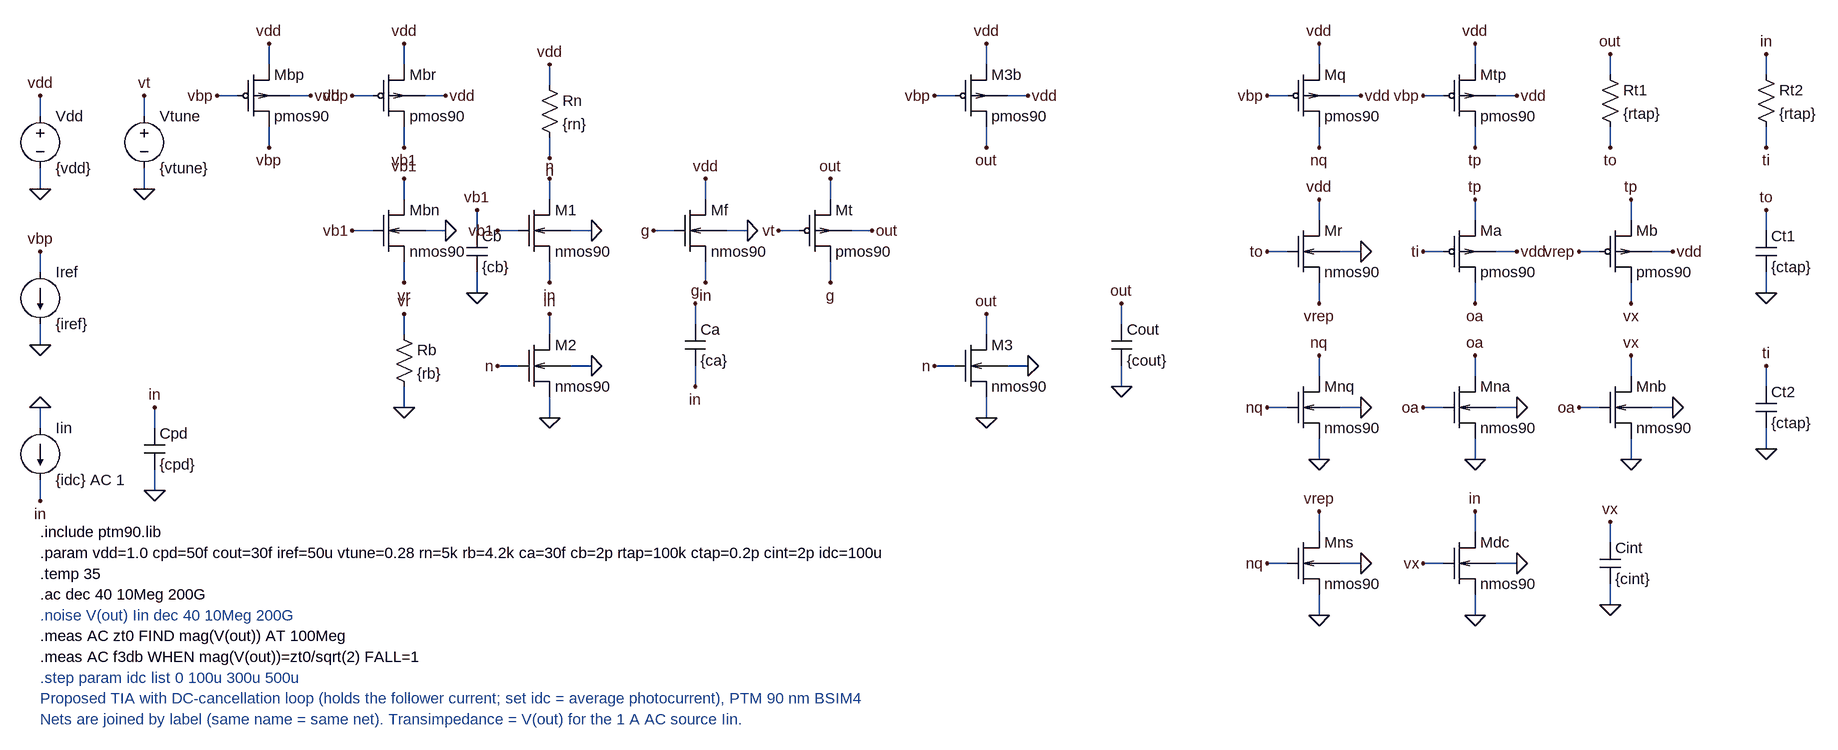
[diagram p0: schematic proposed_tia_dcc.asc]
proposed_tia_dcc.asc, the LTspice schematic file:
Version 4
SHEET 1 2200 1200
WIRE -720 80 -720 48
WIRE -720 160 -720 192
WIRE -560 80 -560 48
WIRE -560 160 -560 192
WIRE -720 320 -720 288
WIRE -720 400 -720 432
WIRE -368 96 -368 128
WIRE -416 48 -448 48
WIRE -368 0 -368 -32
WIRE -336 48 -304 48
WIRE -160 96 -160 128
WIRE -208 48 -240 48
WIRE -160 0 -160 -32
WIRE -128 48 -96 48
WIRE -160 208 -160 176
WIRE -208 256 -240 256
WIRE -160 304 -160 336
WIRE -128 256 -96 256
WIRE -160 416 -160 384
WIRE -160 496 -160 528
WIRE -48 256 -48 224
WIRE -48 320 -48 352
WIRE 64 32 64 0
WIRE 64 112 64 144
WIRE 64 208 64 176
WIRE 16 256 -16 256
WIRE 64 304 64 336
WIRE 96 256 128 256
WIRE 64 416 64 384
WIRE 16 464 -16 464
WIRE 64 512 64 544
WIRE 96 464 128 464
WIRE 736 416 736 384
WIRE 688 464 656 464
WIRE 736 512 736 544
WIRE 768 464 800 464
WIRE 736 96 736 128
WIRE 688 48 656 48
WIRE 736 0 736 -32
WIRE 768 48 800 48
WIRE 304 208 304 176
WIRE 256 256 224 256
WIRE 304 304 304 336
WIRE 336 256 368 256
WIRE 496 304 496 336
WIRE 448 256 416 256
WIRE 496 208 496 176
WIRE 528 256 560 256
WIRE 288 400 288 368
WIRE 288 464 288 496
WIRE 1248 96 1248 128
WIRE 1200 48 1168 48
WIRE 1248 0 1248 -32
WIRE 1280 48 1312 48
WIRE 1248 480 1248 448
WIRE 1200 528 1168 528
WIRE 1248 576 1248 608
WIRE 1280 528 1312 528
WIRE 1696 16 1696 -16
WIRE 1696 96 1696 128
WIRE 1936 256 1936 224
WIRE 1936 320 1936 352
WIRE 1936 16 1936 -16
WIRE 1936 96 1936 128
WIRE 1936 496 1936 464
WIRE 1936 560 1936 592
WIRE 1248 240 1248 208
WIRE 1200 288 1168 288
WIRE 1248 336 1248 368
WIRE 1280 288 1312 288
WIRE 1248 720 1248 688
WIRE 1200 768 1168 768
WIRE 1248 816 1248 848
WIRE 1280 768 1312 768
WIRE 1488 96 1488 128
WIRE 1440 48 1408 48
WIRE 1488 0 1488 -32
WIRE 1520 48 1552 48
WIRE 1488 336 1488 368
WIRE 1440 288 1408 288
WIRE 1488 240 1488 208
WIRE 1520 288 1552 288
WIRE 1728 336 1728 368
WIRE 1680 288 1648 288
WIRE 1728 240 1728 208
WIRE 1760 288 1792 288
WIRE 1488 480 1488 448
WIRE 1440 528 1408 528
WIRE 1488 576 1488 608
WIRE 1520 528 1552 528
WIRE 1728 480 1728 448
WIRE 1680 528 1648 528
WIRE 1728 576 1728 608
WIRE 1760 528 1792 528
WIRE 1696 736 1696 704
WIRE 1696 800 1696 832
WIRE 1488 720 1488 688
WIRE 1440 768 1408 768
WIRE 1488 816 1488 848
WIRE 1520 768 1552 768
WIRE -544 560 -544 528
WIRE -544 624 -544 656
WIRE 944 400 944 368
WIRE 944 464 944 496
WIRE -720 560 -720 528
WIRE -720 640 -720 672
FLAG -720 48 vdd
FLAG -720 192 0
FLAG -560 48 vt
FLAG -560 192 0
FLAG -720 288 vbp
FLAG -720 432 0
FLAG -368 128 vbp
FLAG -448 48 vbp
FLAG -368 -32 vdd
FLAG -304 48 vdd
FLAG -160 128 vb1
FLAG -240 48 vbp
FLAG -160 -32 vdd
FLAG -96 48 vdd
FLAG -160 176 vb1
FLAG -240 256 vb1
FLAG -160 336 vr
FLAG -96 256 0
FLAG -160 384 vr
FLAG -160 528 0
FLAG -48 224 vb1
FLAG -48 352 0
FLAG 64 0 vdd
FLAG 64 144 n
FLAG 64 176 n
FLAG -16 256 vb1
FLAG 64 336 in
FLAG 128 256 0
FLAG 64 384 in
FLAG -16 464 n
FLAG 64 544 0
FLAG 128 464 0
FLAG 736 384 out
FLAG 656 464 n
FLAG 736 544 0
FLAG 800 464 0
FLAG 736 128 out
FLAG 656 48 vbp
FLAG 736 -32 vdd
FLAG 800 48 vdd
FLAG 304 176 vdd
FLAG 224 256 g
FLAG 304 336 in
FLAG 368 256 0
FLAG 496 336 g
FLAG 416 256 vt
FLAG 496 176 out
FLAG 560 256 out
FLAG 288 368 g
FLAG 288 496 in
FLAG 1248 128 nq
FLAG 1168 48 vbp
FLAG 1248 -32 vdd
FLAG 1312 48 vdd
FLAG 1248 448 nq
FLAG 1168 528 nq
FLAG 1248 608 0
FLAG 1312 528 0
FLAG 1696 -16 out
FLAG 1696 128 to
FLAG 1936 224 to
FLAG 1936 352 0
FLAG 1936 -16 in
FLAG 1936 128 ti
FLAG 1936 464 ti
FLAG 1936 592 0
FLAG 1248 208 vdd
FLAG 1168 288 to
FLAG 1248 368 vrep
FLAG 1312 288 0
FLAG 1248 688 vrep
FLAG 1168 768 nq
FLAG 1248 848 0
FLAG 1312 768 0
FLAG 1488 128 tp
FLAG 1408 48 vbp
FLAG 1488 -32 vdd
FLAG 1552 48 vdd
FLAG 1488 368 oa
FLAG 1408 288 ti
FLAG 1488 208 tp
FLAG 1552 288 vdd
FLAG 1728 368 vx
FLAG 1648 288 vrep
FLAG 1728 208 tp
FLAG 1792 288 vdd
FLAG 1488 448 oa
FLAG 1408 528 oa
FLAG 1488 608 0
FLAG 1552 528 0
FLAG 1728 448 vx
FLAG 1648 528 oa
FLAG 1728 608 0
FLAG 1792 528 0
FLAG 1696 704 vx
FLAG 1696 832 0
FLAG 1488 688 in
FLAG 1408 768 vx
FLAG 1488 848 0
FLAG 1552 768 0
FLAG -544 528 in
FLAG -544 656 0
FLAG 944 368 out
FLAG 944 496 0
FLAG -720 528 0
FLAG -720 672 in
SYMBOL voltage -720 64 R0
SYMATTR InstName Vdd
SYMATTR Value {vdd}
SYMBOL voltage -560 64 R0
SYMATTR InstName Vtune
SYMATTR Value {vtune}
SYMBOL current -720 320 R0
SYMATTR InstName Iref
SYMATTR Value {iref}
SYMBOL tia_pmos4 -416 0 R0
SYMATTR InstName Mbp
SYMATTR Value pmos90
SYMATTR Value2 l=180n w=2u ad=0.4p as=0.4p pd=4.4u ps=4.4u
SYMBOL tia_pmos4 -208 0 R0
SYMATTR InstName Mbr
SYMATTR Value pmos90
SYMATTR Value2 l=180n w=2u ad=0.4p as=0.4p pd=4.4u ps=4.4u
SYMBOL tia_nmos4 -208 208 R0
SYMATTR InstName Mbn
SYMATTR Value nmos90
SYMATTR Value2 l=90n w=0.4u ad=0.08p as=0.08p pd=1.2u ps=1.2u
SYMBOL res -176 400 R0
SYMATTR InstName Rb
SYMATTR Value {rb}
SYMBOL cap -64 256 R0
SYMATTR InstName Cb
SYMATTR Value {cb}
SYMBOL res 48 16 R0
SYMATTR InstName Rn
SYMATTR Value {rn}
SYMBOL tia_nmos4 16 208 R0
SYMATTR InstName M1
SYMATTR Value nmos90
SYMATTR Value2 l=90n w=4.5u ad=0.9p as=0.9p pd=9.4u ps=9.4u
SYMBOL tia_nmos4 16 416 R0
SYMATTR InstName M2
SYMATTR Value nmos90
SYMATTR Value2 l=90n w=3.5u ad=0.7p as=0.7p pd=7.4u ps=7.4u
SYMBOL tia_nmos4 688 416 R0
SYMATTR InstName M3
SYMATTR Value nmos90
SYMATTR Value2 l=90n w=7u ad=1.4p as=1.4p pd=14.4u ps=14.4u
SYMBOL tia_pmos4 688 0 R0
SYMATTR InstName M3b
SYMATTR Value pmos90
SYMATTR Value2 l=180n w=28u ad=5.6p as=5.6p pd=56.4u ps=56.4u
SYMBOL tia_nmos4 256 208 R0
SYMATTR InstName Mf
SYMATTR Value nmos90
SYMATTR Value2 l=90n w=3.5u ad=0.7p as=0.7p pd=7.4u ps=7.4u
SYMBOL tia_pmos4 448 208 R0
SYMATTR InstName Mt
SYMATTR Value pmos90
SYMATTR Value2 l=90n w=12u ad=2.4p as=2.4p pd=24.4u ps=24.4u
SYMBOL cap 272 400 R0
SYMATTR InstName Ca
SYMATTR Value {ca}
SYMBOL tia_pmos4 1200 0 R0
SYMATTR InstName Mq
SYMATTR Value pmos90
SYMATTR Value2 l=180n w=0.8u ad=0.16p as=0.16p pd=2u ps=2u
SYMBOL tia_nmos4 1200 480 R0
SYMATTR InstName Mnq
SYMATTR Value nmos90
SYMATTR Value2 l=1440n w=2u ad=0.4p as=0.4p pd=4.4u ps=4.4u
SYMBOL res 1680 0 R0
SYMATTR InstName Rt1
SYMATTR Value {rtap}
SYMBOL cap 1920 256 R0
SYMATTR InstName Ct1
SYMATTR Value {ctap}
SYMBOL res 1920 0 R0
SYMATTR InstName Rt2
SYMATTR Value {rtap}
SYMBOL cap 1920 496 R0
SYMATTR InstName Ct2
SYMATTR Value {ctap}
SYMBOL tia_nmos4 1200 240 R0
SYMATTR InstName Mr
SYMATTR Value nmos90
SYMATTR Value2 l=90n w=1.75u ad=0.35p as=0.35p pd=3.9u ps=3.9u
SYMBOL tia_nmos4 1200 720 R0
SYMATTR InstName Mns
SYMATTR Value nmos90
SYMATTR Value2 l=1440n w=5.7u ad=1.14p as=1.14p pd=11.8u ps=11.8u
SYMBOL tia_pmos4 1440 0 R0
SYMATTR InstName Mtp
SYMATTR Value pmos90
SYMATTR Value2 l=720n w=0.4u ad=0.08p as=0.08p pd=1.2u ps=1.2u
SYMBOL tia_pmos4 1440 240 R0
SYMATTR InstName Ma
SYMATTR Value pmos90
SYMATTR Value2 l=720n w=4u ad=0.8p as=0.8p pd=8.4u ps=8.4u
SYMBOL tia_pmos4 1680 240 R0
SYMATTR InstName Mb
SYMATTR Value pmos90
SYMATTR Value2 l=720n w=4u ad=0.8p as=0.8p pd=8.4u ps=8.4u
SYMBOL tia_nmos4 1440 480 R0
SYMATTR InstName Mna
SYMATTR Value nmos90
SYMATTR Value2 l=1440n w=1u ad=0.2p as=0.2p pd=2.4u ps=2.4u
SYMBOL tia_nmos4 1680 480 R0
SYMATTR InstName Mnb
SYMATTR Value nmos90
SYMATTR Value2 l=1440n w=1u ad=0.2p as=0.2p pd=2.4u ps=2.4u
SYMBOL cap 1680 736 R0
SYMATTR InstName Cint
SYMATTR Value {cint}
SYMBOL tia_nmos4 1440 720 R0
SYMATTR InstName Mdc
SYMATTR Value nmos90
SYMATTR Value2 l=180n w=6u ad=1.2p as=1.2p pd=12.4u ps=12.4u
SYMBOL cap -560 560 R0
SYMATTR InstName Cpd
SYMATTR Value {cpd}
SYMBOL cap 928 400 R0
SYMATTR InstName Cout
SYMATTR Value {cout}
SYMBOL current -720 560 R0
SYMATTR InstName Iin
SYMATTR Value {idc} AC 1
TEXT -720 720 Left 2 !.include ptm90.lib
TEXT -720 752 Left 2 !.param vdd=1.0 cpd=50f cout=30f iref=50u vtune=0.28 rn=5k rb=4.2k ca=30f cb=2p rtap=100k ctap=0.2p cint=2p idc=100u
TEXT -720 784 Left 2 !.temp 35
TEXT -720 816 Left 2 !.ac dec 40 10Meg 200G
TEXT -720 848 Left 2 ;.noise V(out) Iin dec 40 10Meg 200G
TEXT -720 880 Left 2 !.meas AC zt0 FIND mag(V(out)) AT 100Meg
TEXT -720 912 Left 2 !.meas AC f3db WHEN mag(V(out))=zt0/sqrt(2) FALL=1
TEXT -720 944 Left 2 ;.step param idc list 0 100u 300u 500u
TEXT -720 976 Left 2 ;Proposed TIA with DC-cancellation loop (holds the follower current; set idc = average photocurrent), PTM 90 nm BSIM4
TEXT -720 1008 Left 2 ;Nets are joined by label (same name = same net). Transimpedance = V(out) for the 1 A AC source Iin.

The netlist it stands for:
* proposed_tia_dcc.asc
Vdd vdd 0 {vdd}
Vtune vt 0 {vtune}
Iref vbp 0 {iref}
Mbp vbp vbp vdd vdd pmos90 l=180n w=2u ad=0.4p as=0.4p pd=4.4u ps=4.4u
Mbr vb1 vbp vdd vdd pmos90 l=180n w=2u ad=0.4p as=0.4p pd=4.4u ps=4.4u
Mbn vb1 vb1 vr 0 nmos90 l=90n w=0.4u ad=0.08p as=0.08p pd=1.2u ps=1.2u
Rb vr 0 {rb}
Cb vb1 0 {cb}
Rn vdd n {rn}
M1 n vb1 in 0 nmos90 l=90n w=4.5u ad=0.9p as=0.9p pd=9.4u ps=9.4u
M2 in n 0 0 nmos90 l=90n w=3.5u ad=0.7p as=0.7p pd=7.4u ps=7.4u
M3 out n 0 0 nmos90 l=90n w=7u ad=1.4p as=1.4p pd=14.4u ps=14.4u
M3b out vbp vdd vdd pmos90 l=180n w=28u ad=5.6p as=5.6p pd=56.4u ps=56.4u
Mf vdd g in 0 nmos90 l=90n w=3.5u ad=0.7p as=0.7p pd=7.4u ps=7.4u
Mt g vt out out pmos90 l=90n w=12u ad=2.4p as=2.4p pd=24.4u ps=24.4u
Ca g in {ca}
Mq nq vbp vdd vdd pmos90 l=180n w=0.8u ad=0.16p as=0.16p pd=2u ps=2u
Mnq nq nq 0 0 nmos90 l=1440n w=2u ad=0.4p as=0.4p pd=4.4u ps=4.4u
Rt1 out to {rtap}
Ct1 to 0 {ctap}
Rt2 in ti {rtap}
Ct2 ti 0 {ctap}
Mr vdd to vrep 0 nmos90 l=90n w=1.75u ad=0.35p as=0.35p pd=3.9u ps=3.9u
Mns vrep nq 0 0 nmos90 l=1440n w=5.7u ad=1.14p as=1.14p pd=11.8u ps=11.8u
Mtp tp vbp vdd vdd pmos90 l=720n w=0.4u ad=0.08p as=0.08p pd=1.2u ps=1.2u
Ma oa ti tp vdd pmos90 l=720n w=4u ad=0.8p as=0.8p pd=8.4u ps=8.4u
Mb vx vrep tp vdd pmos90 l=720n w=4u ad=0.8p as=0.8p pd=8.4u ps=8.4u
Mna oa oa 0 0 nmos90 l=1440n w=1u ad=0.2p as=0.2p pd=2.4u ps=2.4u
Mnb vx oa 0 0 nmos90 l=1440n w=1u ad=0.2p as=0.2p pd=2.4u ps=2.4u
Cint vx 0 {cint}
Mdc in vx 0 0 nmos90 l=180n w=6u ad=1.2p as=1.2p pd=12.4u ps=12.4u
Cpd in 0 {cpd}
Cout out 0 {cout}
Iin 0 in {idc} AC 1
.model NMOS NMOS
.model PMOS PMOS
.lib standard.mos
.include ptm90.lib
.param vdd=1.0 cpd=50f cout=30f iref=50u vtune=0.28 rn=5k rb=4.2k ca=30f cb=2p rtap=100k ctap=0.2p cint=2p idc=100u
.temp 35
.ac dec 40 10Meg 200G
* .noise V(out) Iin dec 40 10Meg 200G
.meas AC zt0 FIND mag(V(out)) AT 100Meg
.meas AC f3db WHEN mag(V(out))=zt0/sqrt(2) FALL=1
* .step param idc list 0 100u 300u 500u
* Proposed TIA with DC-cancellation loop (holds the follower current; set idc = average photocurrent), PTM 90 nm BSIM4
* Nets are joined by label (same name = same net). Transimpedance = V(out) for the 1 A AC source Iin.
.backanno
.end